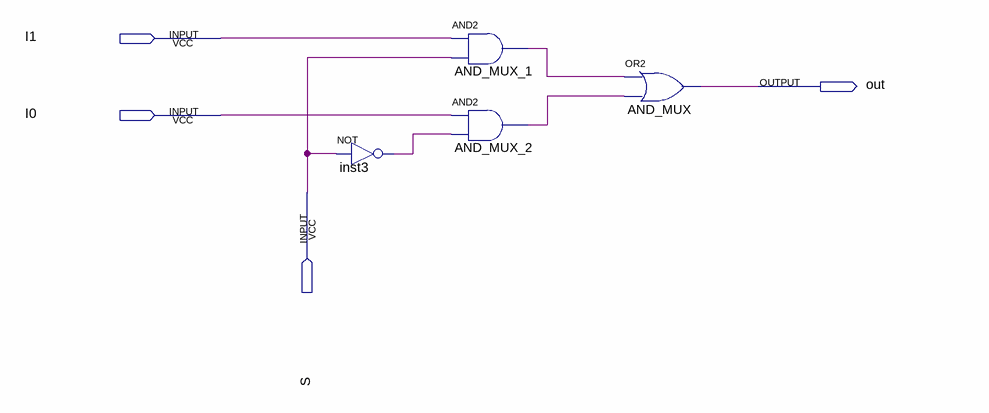
[diagram p0: schematic sheet]
// Quartus schematic mux_2.bdf as structural Verilog: 4 symbols, 4 pins
module mux_2 (
  input  I1,
  input  I0,
  input  S,
  output out
);

  wire AND_MUX_1_out, AND_MUX_2_out, inst3_out;

  not inst3 (inst3_out, S);
  and AND_MUX_1 (AND_MUX_1_out, I1, S);
  and AND_MUX_2 (AND_MUX_2_out, I0, inst3_out);
  or AND_MUX (out, AND_MUX_1_out, AND_MUX_2_out);
endmodule
